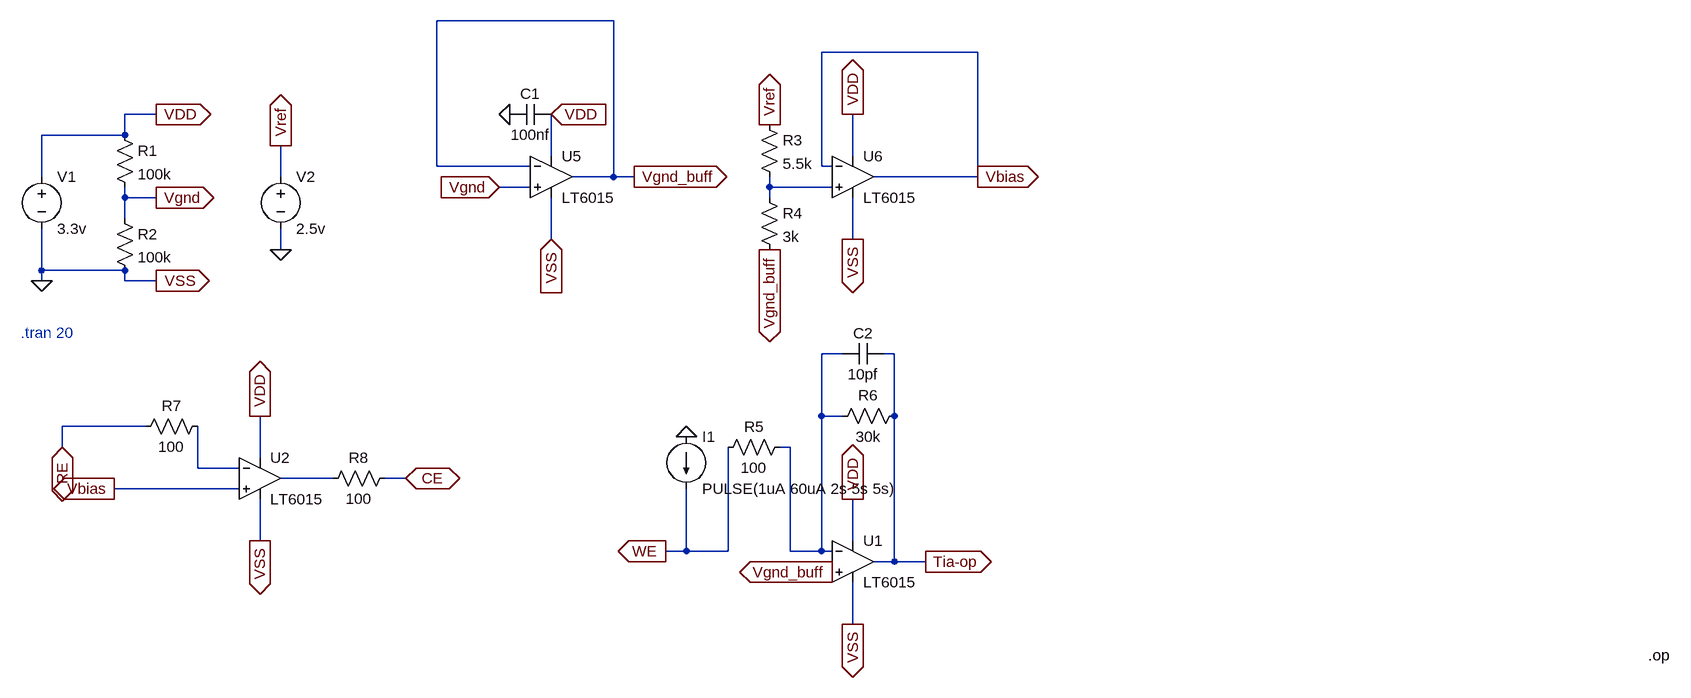
[diagram p0: schematic cgm-testing.asc]
cgm-testing.asc, the LTspice schematic file:
Version 4.1
SHEET 1 2680 920
WIRE 912 -112 640 -112
WIRE 1472 -64 1232 -64
WIRE 208 32 160 32
WIRE 160 64 160 32
WIRE 160 64 32 64
WIRE 816 96 816 32
WIRE 1280 96 1280 32
WIRE 640 112 640 -112
WIRE 784 112 640 112
WIRE 1232 112 1232 -64
WIRE 1248 112 1232 112
WIRE 32 128 32 64
WIRE 400 128 400 80
WIRE 912 128 912 -112
WIRE 912 128 848 128
WIRE 944 128 912 128
WIRE 1472 128 1472 -64
WIRE 1472 128 1312 128
WIRE 784 144 736 144
WIRE 1152 144 1152 128
WIRE 1248 144 1152 144
WIRE 160 160 160 144
WIRE 208 160 160 160
WIRE 1152 160 1152 144
WIRE 160 192 160 160
WIRE 816 224 816 160
WIRE 1280 224 1280 160
WIRE 400 240 400 208
WIRE 32 272 32 208
WIRE 160 272 32 272
WIRE 32 288 32 272
WIRE 160 288 160 272
WIRE 208 288 160 288
WIRE 1264 400 1232 400
WIRE 1344 400 1328 400
WIRE 1232 496 1232 400
WIRE 1264 496 1232 496
WIRE 1344 496 1344 400
WIRE 192 512 64 512
WIRE 64 544 64 512
WIRE 1184 544 1168 544
WIRE 368 560 368 496
WIRE 272 576 272 512
WIRE 336 576 272 576
WIRE 480 592 400 592
WIRE 592 592 560 592
WIRE 336 608 144 608
WIRE 368 688 368 624
WIRE 1280 688 1280 624
WIRE 1024 704 1024 608
WIRE 1024 704 992 704
WIRE 1088 704 1088 544
WIRE 1088 704 1024 704
WIRE 1184 704 1184 544
WIRE 1232 704 1232 496
WIRE 1232 704 1184 704
WIRE 1248 704 1232 704
WIRE 1344 720 1344 496
WIRE 1344 720 1312 720
WIRE 1392 720 1344 720
WIRE 1280 816 1280 752
FLAG 208 32 VDD
IOPIN 208 32 Out
FLAG 208 160 Vgnd
IOPIN 208 160 Out
FLAG 208 288 VSS
IOPIN 208 288 Out
FLAG 400 80 Vref
IOPIN 400 80 Out
FLAG 32 288 0
FLAG 400 240 0
FLAG 816 224 VSS
IOPIN 816 224 In
FLAG 1280 224 VSS
IOPIN 1280 224 Out
FLAG 1280 816 VSS
IOPIN 1280 816 Out
FLAG 368 688 VSS
IOPIN 368 688 Out
FLAG 816 32 VDD
IOPIN 816 32 In
FLAG 1280 32 VDD
IOPIN 1280 32 Out
FLAG 1280 624 VDD
IOPIN 1280 624 Out
FLAG 368 496 VDD
IOPIN 368 496 Out
FLAG 944 128 Vgnd_buff
IOPIN 944 128 Out
FLAG 736 144 Vgnd
IOPIN 736 144 In
FLAG 752 32 0
FLAG 1152 48 Vref
IOPIN 1152 48 Out
FLAG 1152 240 Vgnd_buff
IOPIN 1152 240 Out
FLAG 1472 128 Vbias
IOPIN 1472 128 Out
FLAG 1248 736 Vgnd_buff
IOPIN 1248 736 Out
FLAG 992 704 WE
IOPIN 992 704 Out
FLAG 1392 720 Tia-op
IOPIN 1392 720 Out
FLAG 144 608 Vbias
IOPIN 144 608 Out
FLAG 64 544 RE
IOPIN 64 544 BiDir
FLAG 592 592 CE
IOPIN 592 592 BiDir
FLAG 1024 528 0
SYMBOL voltage 32 112 R0
WINDOW 123 0 0 Left 0
WINDOW 39 0 0 Left 0
SYMATTR InstName V1
SYMATTR Value 3.3v
SYMBOL res 144 48 R0
SYMATTR InstName R1
SYMATTR Value 100k
SYMBOL res 144 176 R0
SYMATTR InstName R2
SYMATTR Value 100k
SYMBOL voltage 400 112 R0
WINDOW 123 0 0 Left 0
WINDOW 39 0 0 Left 0
SYMATTR InstName V2
SYMATTR Value 2.5v
SYMBOL OpAmps\\LT6015 816 128 R0
SYMATTR InstName U5
SYMBOL OpAmps\\LT6015 1280 128 R0
SYMATTR InstName U6
SYMBOL cap 816 16 R90
WINDOW 0 0 32 VBottom 2
WINDOW 3 32 32 VTop 2
SYMATTR InstName C1
SYMATTR Value 100nf
SYMBOL res 1136 32 R0
SYMATTR InstName R3
SYMATTR Value 5.5k
SYMBOL res 1136 144 R0
SYMATTR InstName R4
SYMATTR Value 3k
SYMBOL OpAmps\\LT6015 1280 720 R0
SYMATTR InstName U1
SYMBOL OpAmps\\LT6015 368 592 R0
SYMATTR InstName U2
SYMBOL res 1184 528 R90
WINDOW 0 0 56 VBottom 2
WINDOW 3 32 56 VTop 2
SYMATTR InstName R5
SYMATTR Value 100
SYMBOL res 1360 480 R90
WINDOW 0 0 56 VBottom 2
WINDOW 3 32 56 VTop 2
SYMATTR InstName R6
SYMATTR Value 30k
SYMBOL cap 1328 384 R90
WINDOW 0 0 32 VBottom 2
WINDOW 3 32 32 VTop 2
SYMATTR InstName C2
SYMATTR Value 10pf
SYMBOL res 288 496 R90
WINDOW 0 0 56 VBottom 2
WINDOW 3 32 56 VTop 2
SYMATTR InstName R7
SYMATTR Value 100
SYMBOL res 576 576 R90
WINDOW 0 0 56 VBottom 2
WINDOW 3 32 56 VTop 2
SYMATTR InstName R8
SYMATTR Value 100
SYMBOL current 1024 528 R0
WINDOW 123 0 0 Left 0
WINDOW 39 0 0 Left 0
SYMATTR InstName I1
SYMATTR Value PULSE(1uA 60uA 2s 5s 5s)
TEXT 0 368 Left 2 ;.tran 20
TEXT 2504 864 Left 2 !.op

The netlist it stands for:
* cgm-testing.asc
V1 VDD 0 3.3v
R1 VDD Vgnd 100k
R2 Vgnd 0 100k
V2 Vref 0 2.5v
X§U5 Vgnd Vgnd_buff VDD 0 Vgnd_buff LT6016  ; LT6015, pins In+ In- V+ V- OUT
X§U6 N001 Vbias VDD 0 Vbias LT6016  ; LT6015, pins In+ In- V+ V- OUT
C1 VDD 0 100nf
R3 Vref N001 5.5k
R4 N001 Vgnd_buff 3k
X§U1 Vgnd_buff N002 VDD 0 Tia-op LT6016  ; LT6015, pins In+ In- V+ V- OUT
X§U2 Vbias N003 VDD 0 N004 LT6016  ; LT6015, pins In+ In- V+ V- OUT
R5 N002 WE 100
R6 Tia-op N002 30k
C2 Tia-op N002 10pf
R7 N003 RE 100
R8 CE N004 100
I1 0 WE PULSE(1uA 60uA 2s 5s 5s)
* .tran 20
.op
.lib LTC2.lib
.backanno
.end